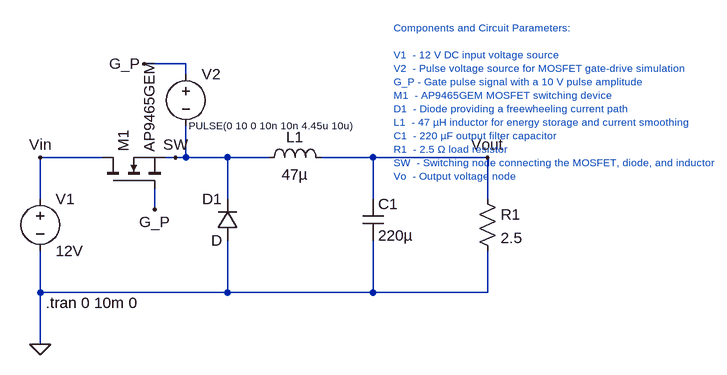
[diagram p0: schematic BuckMod.asc]
BuckMod.asc, the LTspice schematic file:
Version 4.1
SHEET 1 964 680
WIRE 272 -96 208 -96
WIRE 272 -80 272 -96
WIRE 144 48 48 48
WIRE 256 48 240 48
WIRE 272 48 272 0
WIRE 272 48 256 48
WIRE 336 48 272 48
WIRE 400 48 336 48
WIRE 560 48 480 48
WIRE 736 48 560 48
WIRE 48 112 48 48
WIRE 336 112 336 48
WIRE 560 112 560 48
WIRE 736 112 736 48
WIRE 224 128 224 96
WIRE 48 256 48 192
WIRE 336 256 336 176
WIRE 336 256 48 256
WIRE 560 256 560 176
WIRE 560 256 336 256
WIRE 736 256 736 192
WIRE 736 256 560 256
WIRE 48 336 48 256
FLAG 48 336 0
FLAG 48 48 Vin
FLAG 736 48 Vout
FLAG 224 128 G_P
FLAG 208 -96 G_P
FLAG 256 48 SW
SYMBOL voltage 48 96 R0
WINDOW 123 0 0 Left 0
WINDOW 39 0 0 Left 0
SYMATTR InstName V1
SYMATTR Value 12V
SYMBOL ind 384 64 R270
WINDOW 0 32 56 VTop 2
WINDOW 3 5 56 VBottom 2
SYMATTR InstName L1
SYMATTR Value 47µ
SYMATTR SpiceLine Rser=1m
SYMBOL cap 544 112 R0
SYMATTR InstName C1
SYMATTR Value 220µ
SYMBOL diode 352 176 R180
WINDOW 0 24 64 Left 2
WINDOW 3 24 0 Left 2
SYMATTR InstName D1
SYMBOL res 720 96 R0
SYMATTR InstName R1
SYMATTR Value 2.5
SYMBOL nmos 144 96 R270
SYMATTR InstName M1
SYMATTR Value AP9465GEM
SYMBOL voltage 272 -96 R0
WINDOW 3 4 95 Left 1
WINDOW 123 0 0 Left 0
WINDOW 39 0 0 Left 0
SYMATTR Value PULSE(0 10 0 10n 10n 4.45u 10u)
SYMATTR InstName V2
TEXT 592 -152 Left 1 ;Components and Circuit Parameters:\n \nV1  - 12 V DC input voltage source\nV2  - Pulse voltage source for MOSFET gate-drive simulation\nG_P - Gate pulse signal with a 10 V pulse amplitude\nM1  - AP9465GEM MOSFET switching device\nD1  - Diode providing a freewheeling current path\nL1  - 47 µH inductor for energy storage and current smoothing\nC1  - 220 µF output filter capacitor\nR1  - 2.5 Ω load resistor\nSW  - Switching node connecting the MOSFET, diode, and inductor\nVo  - Output voltage node
TEXT 56 272 Left 2 !.tran 0 10m 0

The netlist it stands for:
* BuckMod.asc
V1 Vin 0 12V
L1 SW Vout 47µ Rser=1m
C1 Vout 0 220µ
D1 0 SW D
R1 Vout 0 2.5
M1 Vin G_P SW SW AP9465GEM
V2 G_P SW PULSE(0 10 0 10n 10n 4.45u 10u)
.model D D
.lib standard.dio
.model NMOS NMOS
.model PMOS PMOS
.lib standard.mos
* Components and Circuit Parameters:
* V1  - 12 V DC input voltage source
* V2  - Pulse voltage source for MOSFET gate-drive simulation
* G_P - Gate pulse signal with a 10 V pulse amplitude
* M1  - AP9465GEM MOSFET switching device
* D1  - Diode providing a freewheeling current path
* L1  - 47 µH inductor for energy storage and current smoothing
* C1  - 220 µF output filter capacitor
* R1  - 2.5 Ω load resistor
* SW  - Switching node connecting the MOSFET, diode, and inductor
* Vo  - Output voltage node
.tran 0 10m 0
.backanno
.end